# Altium schematic sheet 02_ALIMENTACION.SchDoc: Alimentación: red, 12 V y 3,3 V
size 420 x 297 mm; Address1: Hardware en IoT · 2026; SheetNumber: 2; SheetTotal: 6
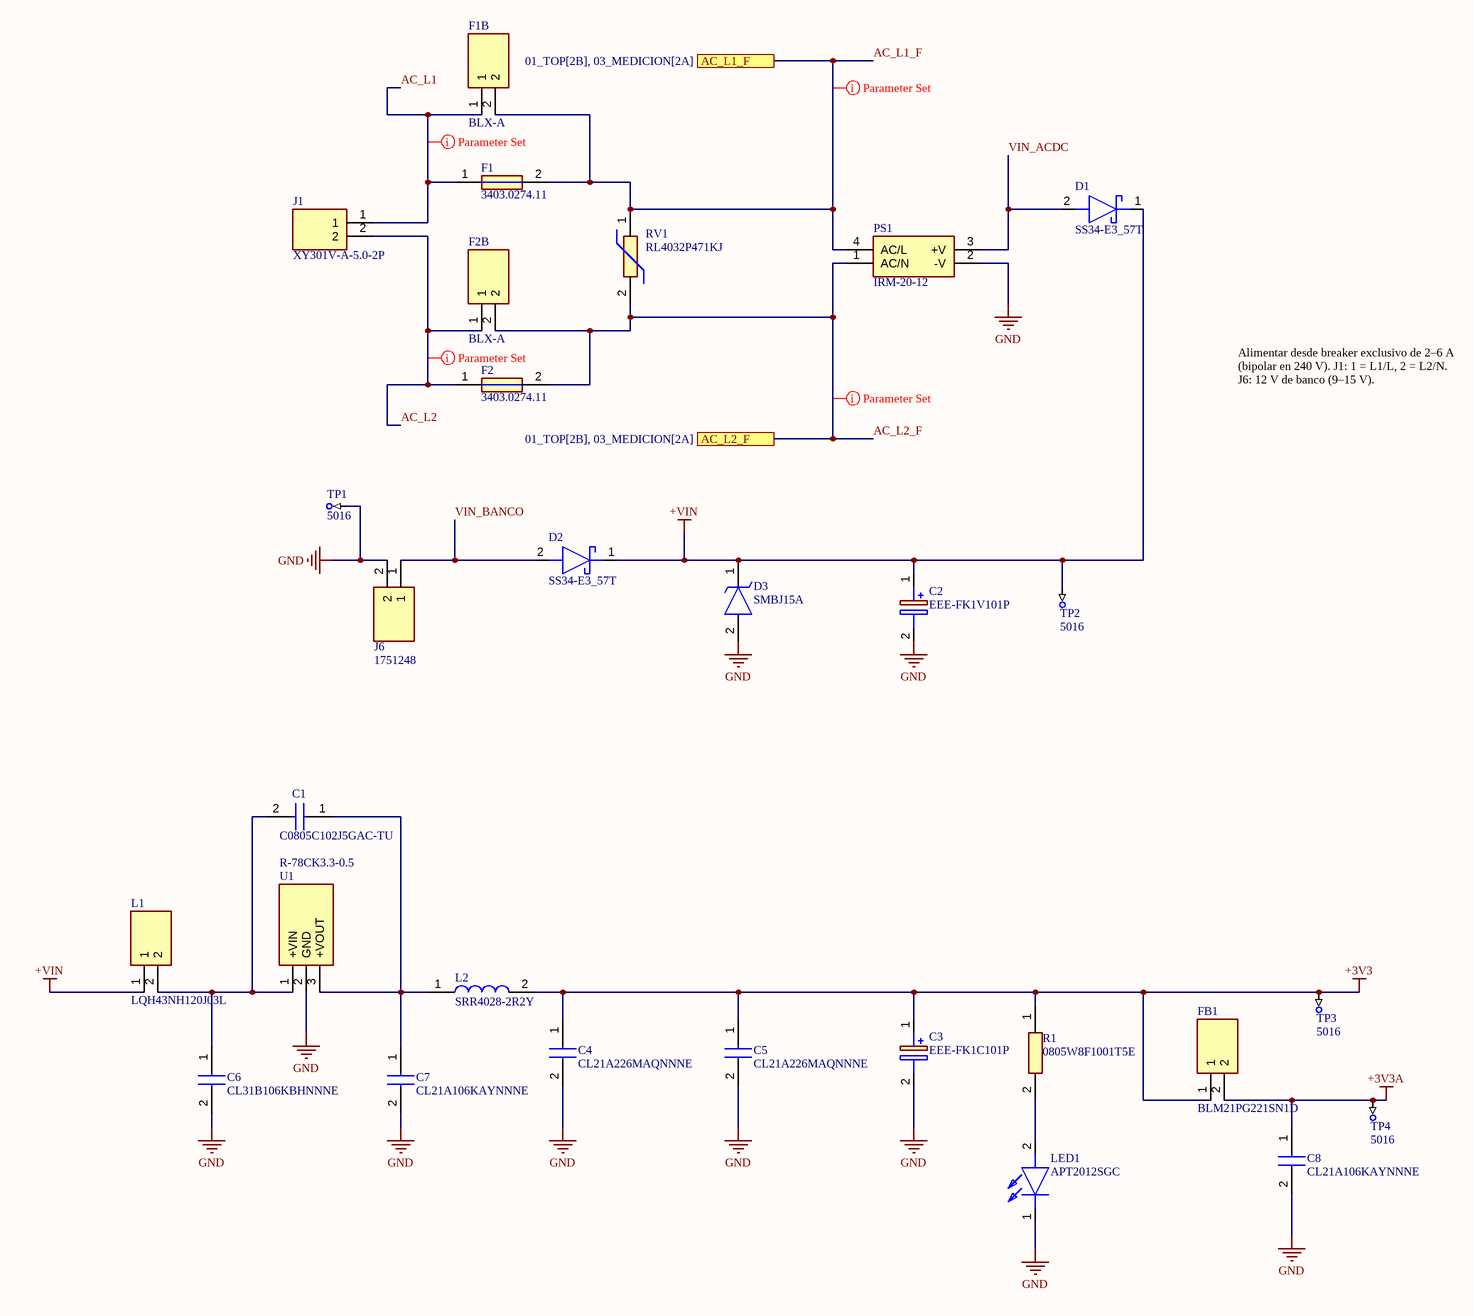
[diagram p0: 02_ALIMENTACION.SchDoc]

## Parts
C1  C0805C102J5GAC-TU  [CAPC2012X88N]
C2  EEE-FK1V101P  [EEHZT1E331UP]
C3  EEE-FK1C101P  [EEE1AA101SP]
C4  CL21A226MAQNNNE  [CAPC2012X140N]
C5  CL21A226MAQNNNE  [CAPC2012X140N]
C6  CL31B106KBHNNNE  [CAPC3216X180N]
C7  CL21A106KAYNNNE  [CAPC2012X145N]
C8  CL21A106KAYNNNE  [CAPC2012X145N]
D1  SS34-E3_57T  [DIOM7959X262N]
D2  SS34-E3_57T  [DIOM7959X262N]
D3  SMBJ15A  [DIOM5436X244N]
F1  3403.0274.11  [3403027423]
F1B  BLX-A  [BLX-A_5X20]
F2  3403.0274.11  [3403027423]
F2B  BLX-A  [BLX-A_5X20]
FB1  BLM21PG221SN1D  [BEADC2012X105N]
J1  XY301V-A-5.0-2P  [TB001-500-02BE]
J6  1751248  [1751248]
L1  LQH43NH120J03L  [RLS126]
L2  SRR4028-2R2Y  [SRR4028]
LED1  APT2012SGC  [LEDC2012X85N]
PS1  IRM-20-12  [IRM2012]
R1  0805W8F1001T5E  [RESC2012X60N]
RV1  RL4032P471KJ  [CU4032]
TP1  5016  [KEYSTONE-5016_V]
TP2  5016  [KEYSTONE-5016_V]
TP3  5016  [KEYSTONE-5016_V]
TP4  5016  [KEYSTONE-5016_V]
U1  R-78CK3.3-0.5  [R78CK3305]

## Ports
AC_L1_F (see 01_TOP[2B], 03_MEDICION[2A]), AC_L2_F (see 01_TOP[2B], 03_MEDICION[2A])

## Nets
+3V3: C3.1(+) C4.1 C5.1 FB1.1 L2.2 R1.1 TP3.1
+3V3A: C8.1 FB1.2 TP4.1
+VIN: C2.1(+) D1.1(K) D2.1(K) D3.1(K) L1.1 TP2.1
GND: C2.2(-) C3.2(-) C4.2 C5.2 C6.2 C7.2 C8.2 D3.2(A) J6.2 LED1.1(K) PS1.2(-V) TP1.1 U1.2(GND)
AC_L1: F1.1 F1B.1 J1.1
AC_L1_F: F1.2 F1B.2 PS1.4(AC/L) RV1.1 ; port AC_L1_F
AC_L2: F2.1 F2B.1 J1.2
AC_L2_F: F2.2 F2B.2 PS1.1(AC/N) RV1.2 ; port AC_L2_F
VIN_ACDC: D1.2(A) PS1.3(+V)
VIN_BANCO: D2.2(A) J6.1
NetC1_1: C1.1 C7.1 L2.1 U1.3(+VOUT)
NetC1_2: C1.2 C6.1 L1.2 U1.1(+VIN)
NetLED1_2: LED1.2(A) R1.2

## Layout directives
net class HV_AC: AC_L1, AC_L1_F, AC_L2, AC_L2_F

## Notes on the sheet
- Alimentar desde breaker exclusivo de 2–6 A (bipolar en 240 V). J1: 1 = L1/L, 2 = L2/N. J6: 12 V de banco (9–15 V).
- CONTROL DE CARGA EVSE · HARDWARE EN IOT 2026
- DISEÑO: NICOLÁS GÓMEZ RAMÍREZ
- DWG NO:
- REVISION
- REV:
- DESCRIPTION
- DATE
- APPROVED
- ZONA DE RED 120–240 VAC CON AISLAMIENTO REFORZADO
- USO ACADÉMICO, SIN GARANTÍA.
- ENG:
- APPROVALS
- PROJECT
- DSN:
- CHK:
- REFERENCE DOCUMENTS
- PROJECT REVISION:
- TITLE
- DOCUMENT REVISION:
- DESIGN BY:
- BOM:
- FAB DWG:
- PCB DWG:
- ASSY DWG:
- SCALE:
- A3
- SIZE
- CAGE CODE
- FILE NAME
- DWG NO.
- SHEET
- OF
- REV

## Library data of the parts
C1 = C0805C102J5GAC-TU: Capacitor; Manufacturer_Name: KEMET; Manufacturer_Part_Number: C0805C102J5GACTU; Assembly: JLCPCB; Value: 1nF 50V C0G; Datasheet Link: https://www.kemet.com/specsheet/C0805C102J5GACTU; Height: 0.88mm; Supplier: JLCPCB; Supplier PN: LCSC C2167084
C2 = EEE-FK1V101P: Capacitor Polarised; Manufacturer_Name: Panasonic; Assembly: JLCPCB; Value: 100uF 35V; Datasheet Link: http://industrial.panasonic.com/cdbs/www-data/pdf/RDE0000/ABA0000C1181.pdf; Height: 10.8mm; Manufacturer_Part_Number: EEE-FK1V101P; Supplier: JLCPCB; Supplier PN: LCSC C128462
C3 = EEE-FK1C101P: Capacitor Polarised; Manufacturer_Name: Panasonic; Assembly: JLCPCB; Value: 100uF 16V; Datasheet Link: http://industrial.panasonic.com/cdbs/www-data/pdf/RDE0000/ABA0000C1181.pdf; Height: 7.8mm; Manufacturer_Part_Number: EEE-FK1C101P; Supplier: JLCPCB; Supplier PN: LCSC C128532
C4 C5 = CL21A226MAQNNNE: Capacitor; Manufacturer_Name: Samsung Electro-Mechanics; Assembly: JLCPCB; Value: 22uF 25V; Datasheet Link: https://datasheet.datasheetarchive.com/originals/distributors/Datasheets-DGA10/2406310.pdf; Height: 1.4mm; Manufacturer_Part_Number: CL21A226MAQNNNE; Supplier: JLCPCB; Supplier PN: LCSC C45783
C6 = CL31B106KBHNNNE: Capacitor; Manufacturer_Name: Samsung Electro-Mechanics; Assembly: JLCPCB; Value: 10uF 50V; Datasheet Link: https://datasheet.datasheetarchive.com/originals/distributors/DKDS-19/375194.pdf; Height: 1.8mm; Manufacturer_Part_Number: CL31B106KBHNNNE; Supplier: JLCPCB; Supplier PN: LCSC C89632
C7 C8 = CL21A106KAYNNNE: Capacitor; Manufacturer_Name: Samsung Electro-Mechanics; Assembly: JLCPCB; Value: 10uF 25V; Datasheet Link: https://datasheet.datasheetarchive.com/originals/distributors/Datasheets_SAMA/6a45835c9b7400e9b49c55c38a8ff4a2.pdf; Height: 1.45mm; Manufacturer_Part_Number: CL21A106KAYNNNE; Supplier: JLCPCB; Supplier PN: LCSC C15850
D1 D2 = SS34-E3_57T: Schottky Diode; Manufacturer_Name: Vishay; Manufacturer_Part_Number: SS34-E3/57T; Assembly: JLCPCB; Value: 40V 3A; Datasheet Link: https://www.vishay.com/docs/88751/ss32.pdf; Height: 2.62mm; Supplier: JLCPCB; Supplier PN: LCSC C13354
D3 = SMBJ15A: TVS Diode (Uni-directional); Manufacturer_Name: Littelfuse; Assembly: JLCPCB; Value: 15V 600W; Datasheet Link: http://www.vishay.com/docs/88392/smbj.pdf; Height: 2.44mm; Manufacturer_Part_Number: SMBJ15A; Supplier: JLCPCB; Supplier PN: LCSC C83846
F1 F2 = 3403.0274.11: Fusible SMD UMT-H T1A 277 VAC, ruptura 1500 A (bolsa); Manufacturer_Name: Schurter; Assembly: JLCPCB; Manufacturer_Part_Number: 3403.0274.11; Supplier: JLCPCB; Supplier PN: LCSC C6384960; Value: T1A 277VAC
F1B F2B = BLX-A: Portafusible 5x20 mm para PCB, 2 pines a 22 mm (XC Electronics BLX-A, LCSC C3131); Assembly: DNP; Value: 5x20 6.3A 250V; Manufacturer_Name: XC Electronics; Manufacturer_Part_Number: BLX-A; Supplier: Sigma; Supplier PN: BLX-A
FB1 = BLM21PG221SN1D: Ferrite Bead; Manufacturer_Name: Murata; Assembly: JLCPCB; Value: 220R@100MHz; Datasheet Link: https://datasheet.datasheetarchive.com/originals/dk/DKDS-31/605570.pdf; Height: 1.05mm; Manufacturer_Part_Number: BLM21PG221SN1D; Supplier: JLCPCB; Supplier PN: LCSC C85840
J1 = XY301V-A-5.0-2P: Bornera de tornillo 2 polos, paso 5.0 mm, 300 V 15 A, 22-14 AWG; Manufacturer_Name: Xinlaiya; Assembly: JLCPCB; Value: 2P 5.0mm 300V; Manufacturer_Part_Number: XY301V-A-5.0-2P; Supplier: JLCPCB; Supplier PN: LCSC C557651
J6 = 1751248: Connector; Manufacturer_Name: Phoenix Contact; Assembly: JLCPCB; Value: 2P 3.5mm; Datasheet Link: https://www.phoenixcontact.com/en-us/products/printed-circuit-board-terminal-mkds-1-2-35-1751248?type=pdf; Height: 8.65mm; Manufacturer_Part_Number: 1751248; Supplier: JLCPCB; Supplier PN: LCSC C89122
L1 = LQH43NH120J03L: Inductor 12 uH 5% 420 mA 0.25 ohm 1812, AEC-Q200; Manufacturer_Name: Murata; Assembly: JLCPCB; Value: 12uH; Manufacturer_Part_Number: LQH43NH120J03L; Supplier: JLCPCB; Supplier PN: LCSC C3224514
L2 = SRR4028-2R2Y: Inductor; Manufacturer_Name: Bourns; Assembly: JLCPCB; Value: 2.2uH; Datasheet Link: https://www.bourns.com/pdfs/SRR4028.pdf; Manufacturer_Part_Number: SRR4028-2R2Y; Supplier: JLCPCB; Supplier PN: LCSC C2041777
LED1 = APT2012SGC: LED; Manufacturer_Name: Kingbright; Assembly: JLCPCB; Value: verde; Datasheet Link: http://www.us.kingbright.com/images/catalog/SPEC/APT2012SGC.pdf; Height: 0.85mm; Manufacturer_Part_Number: APT2012SGC; Supplier: JLCPCB; Supplier PN: LCSC C5353439
PS1 = IRM-20-12: Power Supply; Manufacturer_Name: Mean Well; Assembly: JLCPCB; Value: 12V 1.8A; Datasheet Link: https://www.meanwell.com/Upload/PDF/IRM-20/IRM-20-SPEC.PDF; Height: 24mm; Manufacturer_Part_Number: IRM-20-12; Supplier: JLCPCB; Supplier PN: LCSC C5278499
R1 = 0805W8F1001T5E: Resistor 1 kOhm 1% 125 mW 0805; Manufacturer_Name: UNI-ROYAL; Assembly: JLCPCB; Value: 1k; Manufacturer_Part_Number: 0805W8F1001T5E; Supplier: JLCPCB; Supplier PN: LCSC C17513
RV1 = RL4032P471KJ: Varistor SMD 300 VAC, 470 V, 2500 A (8/20 us), 30 J, 4032; Manufacturer_Name: Ruilon; Assembly: JLCPCB; Value: 300VAC; Manufacturer_Part_Number: RL4032P471KJ; Supplier: JLCPCB; Supplier PN: LCSC C2935514
TP1-TP4 = CMP-2000-05178-1: Test Point, 1-Pin SMT, RoHS, Tape and Reel; Manufacturer: Keystone; Manufacturer_Name: ronghe; Manufacturer_Part_Number: RH-5016; Other Names: 5016KDKR; Featured Product: SurfaceMountTestPoints / 5019MiniatureSurfaceMountTestPoint; Online Catalog: SurfaceMountTestPoints; Catalog Drawings: 5016Top / 5016Side / 5016Front; Value: TP; Assembly: JLCPCB; Packaging: Digi-Reel; RoHS Information: RoHSComplianceStatement; Package Reference: 5016; Mounting Type: SurfaceMount; Type: PCTestPoint,Compact; Manufacturer URL: http://www.keyelco.com/; Standard Package: 1; Package Description: 1-Pin Test Point, Body 3.81 x 2.04 mm; Category: TestandMeasurement; Terminal: 0.015"(0.38mm)PhosphorBronze,SilverPlated; Datasheet URL: https://ciiva.com/datasheet-click-2917613?src=ciiva&sig=4a4e90f; Datasheet Version: Rev. D, 03/2014; Family: TestPoints; Material: PhosphorBronze; Supplier: JLCPCB; Supplier PN: LCSC C5199799
U1 = R-78CK3.3-0.5: Regulador conmutado 3.3 V 0.5 A, SIP3; Manufacturer_Name: RECOM Power; Assembly: Manual; Datasheet Link: https://recom-power.com/pdf/Innoline/R-78CK-0.5.pdf; Height: 10.7mm; Manufacturer_Part_Number: R-78CK3.3-0.5; Supplier: Disponible; Supplier PN: -; Value: 3.3V 0.5A